# Altium schematic sheet Power_DCDC12_5.SchDoc
size A4
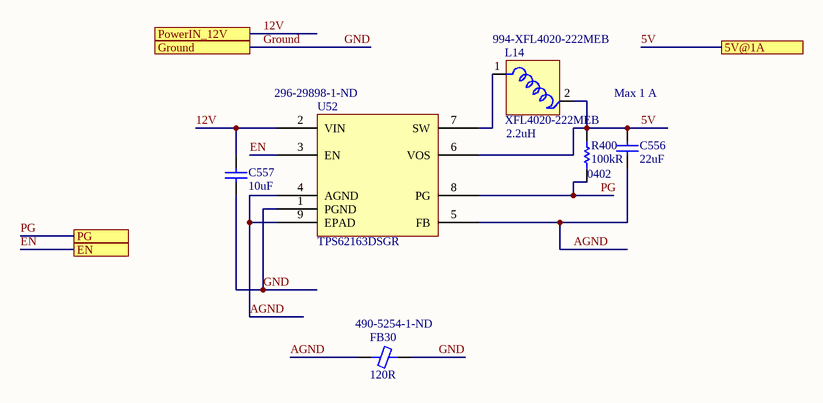
[diagram p0: Power_DCDC12_5.SchDoc]

## Parts
C556  22uF  [CAP 0603/1608 RF]
C557  10uF  [CAP 0805/2012 RF]
FB30  120R  Supplier Part Number 1: 490-5254-1-ND  [FER 0603/1608]
L14  XFL4020-222MEB  Inductance: 2.2uH  Supplier Part Number 1: 994-XFL4020-222MEB  [XFL4020 Series]
R400  100kR  Case/Package: 0402  [RES 0402/1005 RF]
U52  TPS62163DSGR  Supplier Part Number 1: 296-29898-1-ND  [TPS62163]

## Ports
5V@1A, EN, Ground, PG, PowerIN_12V

## Nets
5V: C556.2 L14.2 R400.2 U52.6(VOS) ; port 5V@1A
12V: C557.2 U52.2(VIN) ; port PowerIN_12V
AGND: C556.1 FB30.1 U52.4(AGND) U52.5(FB) U52.9(EPAD)
EN: U52.3(EN) ; port EN
GND: C557.1 FB30.2 U52.1(PGND) ; port Ground  [also labelled Ground]
PG: R400.1 U52.8(PG) ; port PG
NetL14_1: L14.1 U52.7(SW)

## Notes on the sheet
- Max 1 A
- Title
- Size:
- Date:
- A3
- Number:
- Time:
- Revision:
- Sheet
- of
- File:

## Library data of the parts
C556 = Capacitor: 0603 22 uF 10 V ±20% Tolerance X5R Multilayer Ceramic Chip Capacitor; Manufacturer: Murata; Manufacturer Part Number: GRM188R61A226ME15D; Voltage Rating: 10V; Supplier 1: Digi-Key; Supplier Part Number 1: 490-10476-1-ND; RoHS: Yes; Category: Ceramic Capacitors; Stock 1: 1699777; Pricing 1: 1=0,31000, 10=0,21500, 100=0,12160, 500=0,08584, 1000=0,07512 (USD); Mount: Surface Mount; Case/Package: 0603; Weight: 0.000222oz; Case Code (Metric): 1608; Case Code (Imperial): 0603; Material: Ceramic; Min Operating Temperature: -55°C; Max Operating Temperature: 85°C; Capacitance: 22uF; Tolerance: 20%; Packaging: Tape and Reel; Dielectric: X5R; Termination: SMD/SMT; Voltage Rating (DC): 10V; Package Quantity: 4000; Length: 1.6mm; Height: 0.8mm; Width: 0.8mm; Thickness: 0.039inch; Depth: 0.8mm; REACH SVHC: No SVHC; Lead Free: Lead Free; ComponentLink1URL: https://datasheet.ciiva.com/46444/1769893-46444975.pdf?src-supplier=Element14; ComponentLink1Description: https://datasheet.ciiva.com/46444/1769893-46444975.pdf?src-supplier=Element14
C557 = Capacitor: Manufacturer 1: Samsung; Manufacturer Part Number 1: CL21A106KOQNNNG; Material: Ceramic; Tolerance: 10%; Dielectric: X5R; Voltage: 16V; Supplier 1: Digi-Key; Supplier Part Number 1: 1276-6455-1-ND; Stock 1: 326474; Pricing 1: 1=0.15000, 10=0.10800, 100=0.05100, 500=0.03576, 1000=0.02961 (USD); RoHS: Yes; Mount: Surface Mount; Case/Package: 0805; Case Code (Metric): 2012; Case Code (Imperial): 0805; Min Operating Temperature: -55°C; Max Operating Temperature: 85°C; Capacitance: 10uF; Packaging: Tape and Reel; Package Quantity: 3000; Voltage Rating: 16V; Length: 2mm; Height: 1.25mm; Depth: 1.25mm; Width: 0.049inch; Thickness: 0.053inch; ComponentLink1URL: https://datasheet.ciiva.com/25730/cl21a106koqnnng-25730226.pdf?src-supplier=Digi-Key; ComponentLink1Description: https://datasheet.ciiva.com/25730/cl21a106koqnnng-25730226.pdf?src-supplier=Digi-Key; ComponentLink2URL: https://datasheet.ciiva.com/29199/454932-da-01-en-vs-kondensator-0805-29199423.pdf?src-supplier=Conrad; ComponentLink2Description: https://datasheet.ciiva.com/29199/454932-da-01-en-vs-kondensator-0805-29199423.pdf?src-supplier=Conrad
FB30 = Ferrite: MURATA - BLM18KG121TN1D - Ferritperle, 0603 [Metrisch 1608], 120 ohm, 3 A, Baureihe EMIFIL BLM18K, 0.03 ohm, ± 25%; Material: Ferrite,Steel; Current Rating: 3A; Number of Lines: 1; DC Resistance (DCR): 30mR; Test Frequency: 100MHz; Supplier 1: Digi-Key; Manufacturer: Murata; Manufacturer Part Number: BLM18KG121TN1D; RoHS: Yes; Category: Ferrite Beads and Chips; Stock 1: 82357; Pricing 1: 1=0,10000, 10=0,07900, 25=0,07120, 50=0,05220, 100=0,04510, 250=0,03564, 500=0,03010, 1000=0,02534 (USD); Case/Package: 0603; Number of Pins: 2; Core Material: Ferrite; Case Code (Metric): 1608; Case Code (Imperial): 0603; Min Operating Temperature: -55°C; Max Operating Temperature: 125°C; Impedance: 120R; Package Quantity: 4000; Tolerance: 25%; Packaging: Tape and Reel; Max Current Rating: 3A; Max DC Current: 3A; Termination: SMD/SMT; Number of Circuits: 1; Length: 1.6mm; Height: 0.8mm; Width: 0.8mm; Depth: 0.95mm; REACH SVHC: No SVHC; Lead Free: Lead Free; ComponentLink1URL: https://datasheet.ciiva.com/11795/0900766b81076276-11795748.pdf?src-supplier=RSComponents; ComponentLink1Description: https://datasheet.ciiva.com/11795/0900766b81076276-11795748.pdf?src-supplier=RSComponents; ComponentLink2URL: https://datasheet.ciiva.com/1012/l0110e-1012353.pdf?src-supplier=Digi-Key; ComponentLink2Description: https://datasheet.ciiva.com/1012/l0110e-1012353.pdf?src-supplier=Digi-Key; ComponentLink3URL: https://datasheet.ciiva.com/1012/l0110e-1012354.pdf?src-supplier=Digi-Key; ComponentLink3Description: https://datasheet.ciiva.com/1012/l0110e-1012354.pdf?src-supplier=Digi-Key; ComponentLink4URL: https://datasheet.ciiva.com/1012/l0110e-1012355.pdf?src-supplier=Digi-Key; ComponentLink4Description: https://datasheet.ciiva.com/1012/l0110e-1012355.pdf?src-supplier=Digi-Key; ComponentLink5URL: https://datasheet.ciiva.com/22715/486545-22715701.pdf?src-supplier=Element14; ComponentLink5Description: https://datasheet.ciiva.com/22715/486545-22715701.pdf?src-supplier=Element14; ComponentLink6URL: https://datasheet.ciiva.com/41449/001172289-da-01-en-drossel-0603-120r-1-6x0-8mm-4000st-41449628.pdf?src-supplier=Conrad; ComponentLink6Description: https://datasheet.ciiva.com/41449/001172289-da-01-en-drossel-0603-120r-1-6x0-8mm-4000st-41449628.pdf?src-supplier=Conrad
L14 = XFL4020-222MEB: Power inductor, shielded, 20% tol, SMT, RoHS, halogen free; Manufacturer: Coilcraft; Core Material: Composite; Self Resonant Frequency: 38MHz; Max DC Current: 8A; DC Resistance (DCR): 23.5mR; Test Frequency: 100kHz; Supplier 1: Mouser; Manufacturer Part Number: XFL4020-222MEB; RoHS: Yes; Category: Fixed Inductors; Stock 1: 10527; Pricing 1: 1=2,13000, 10=2,13000, 50=1,85000, 100=1,55000, 200=1,55000, 500=0,96000 (USD); Min Operating Temperature: -40°C; Max Operating Temperature: 125°C; Packaging: Tape and Reel; Tolerance: 20%; Shielding: Shielded; Termination: SMD/SMT; Package Quantity: 25; Length: 4.3mm; Height: 2.1mm; Width: 4.3mm; Lead Free: Contains Lead; ComponentLink1URL: http://www.mouser.com/ds/2/597/xfl4020-270756.pdf?src-supplier=Mouser; ComponentLink1Description: http://www.mouser.com/ds/2/597/xfl4020-270756.pdf?src-supplier=Mouser
R400 = Resistor: Manufacturer 1: Panasonic; Manufacturer Part Number 1: ERA-2AED104X; Tolerance: 0.5%; Power Rating: 63mW; Voltage Rating: 25V; Temperature Coefficient: 25ppm/°C; Supplier 1: Digi-Key; Supplier Part Number 1: P100KDECT-ND; Stock 1: 54338; Pricing 1: 1=0.22000, 10=0.18800, 100=0.07350, 1000=0.03077, 2500=0.02820, 5000=0.02564 (USD); RoHS: Yes; Mount: Surface Mount; Case Code (Imperial): 0402; Case Code (Metric): 1005; Contact Plating: Tin; Min Operating Temperature: -55°C; Max Operating Temperature: 155°C; Resistance: 100kR; Packaging: Tape and Reel; Package Quantity: 10000; Composition: Metal Film,Thin Film; Number of Terminations: 2; Military Standard: Not; Termination: SMD/SMT; Max Power Dissipation: 63mW; Voltage Rating (DC): 25V; Length: 1mm; Height: 0.016inch; Width: 0.5mm; Depth: 0.5mm; Radiation Hardening: No; REACH SVHC: No SVHC; Lead Free: Lead Free; ComponentLink1URL: https://datasheet.ciiva.com/24028/aoa0000ce26-197354-24028150.pdf?src-supplier=Mouser; ComponentLink1Description: https://datasheet.ciiva.com/24028/aoa0000ce26-197354-24028150.pdf?src-supplier=Mouser; ComponentLink2URL: https://datasheet.ciiva.com/43470/1776116-43470438.pdf?src-supplier=Farnell; ComponentLink2Description: https://datasheet.ciiva.com/43470/1776116-43470438.pdf?src-supplier=Farnell; ComponentLink3URL: https://datasheet.ciiva.com/7830/1776116-7830920.pdf?src-supplier=Element14; ComponentLink3Description: https://datasheet.ciiva.com/7830/1776116-7830920.pdf?src-supplier=Element14; ComponentLink4URL: https://datasheet.ciiva.com/46378/1776116-46378234.pdf?src-supplier=Element14; ComponentLink4Description: https://datasheet.ciiva.com/46378/1776116-46378234.pdf?src-supplier=Element14; ComponentLink5URL: https://datasheet.ciiva.com/16780/70068849-16780139.pdf?src-supplier=Allied+Electronics; ComponentLink5Description: https://datasheet.ciiva.com/16780/70068849-16780139.pdf?src-supplier=Allied+Electronics; ComponentLink6URL: https://datasheet.ciiva.com/9117/aoa0000ce26-9117229.pdf?src-supplier=Avnet; ComponentLink6Description: https://datasheet.ciiva.com/9117/aoa0000ce26-9117229.pdf?src-supplier=Avnet; ComponentLink7URL: https://datasheet.ciiva.com/16511/aoa0000ce26-16511566.pdf?src-supplier=Avnet+Asia; ComponentLink7Description: https://datasheet.ciiva.com/16511/aoa0000ce26-16511566.pdf?src-supplier=Avnet+Asia; ComponentLink8URL: https://datasheet.ciiva.com/30225/54aoa0000ce26-30225311.pdf?src-supplier=Onlinecomponents.com; ComponentLink8Description: https://datasheet.ciiva.com/30225/54aoa0000ce26-30225311.pdf?src-supplier=Onlinecomponents.com
U52 = TPS62163DSGR: IC REG BUCK 5V 1A SYNC 8WSON; Manufacturer 1: Texas Instruments; Switching Frequency: 2.25MHz; Number of Outputs: 1; Max Input Voltage: 17V; Min Input Voltage: 3V; Synchronous Rectifier: Yes; Quiescent Current: 17uA; Output Type: Fixed; Output Configuration: Positive; Manufacturer Part Number 1: TPS62163DSGR; Stock 1: 19908; Pricing 1: 1=1.79000, 10=1.61000, 100=1.29440, 500=1.06348, 1000=0.88117 (USD); RoHS: Yes; Case/Package: SOIC; Number of Pins: 8; Contact Plating: Gold; Min Operating Temperature: -40°C; Max Operating Temperature: 125°C; Packaging: Tape and Reel; Package Quantity: 1; Output Voltage: 5V; Output Current: 1A; Max Output Current: 1A; Min Output Voltage: 5V; Max Output Voltage: 5V; Operating Supply Voltage: 17V; REACH SVHC: No SVHC; Lead Free: Lead Free; ComponentLink1URL: https://datasheet.ciiva.com/4880/slvsam2a-198231-4880752.pdf?src-supplier=Mouser; ComponentLink1Description: https://datasheet.ciiva.com/4880/slvsam2a-198231-4880752.pdf?src-supplier=Mouser; ComponentLink2URL: https://datasheet.ciiva.com/2034/tps62160-2034672.pdf?src-supplier=Digi-Key; ComponentLink2Description: https://datasheet.ciiva.com/2034/tps62160-2034672.pdf?src-supplier=Digi-Key; ComponentLink3URL: https://datasheet.ciiva.com/2034/tps62160-2034673.pdf?src-supplier=Digi-Key; ComponentLink3Description: https://datasheet.ciiva.com/2034/tps62160-2034673.pdf?src-supplier=Digi-Key; ComponentLink4URL: https://datasheet.ciiva.com/2034/tps62160-2034674.pdf?src-supplier=Digi-Key; ComponentLink4Description: https://datasheet.ciiva.com/2034/tps62160-2034674.pdf?src-supplier=Digi-Key; Supplier 1: Digi-Key